# EAGLE board RU-PCBA-2X2-001-03 (EAGLE 9.7.0), part 1 of 17
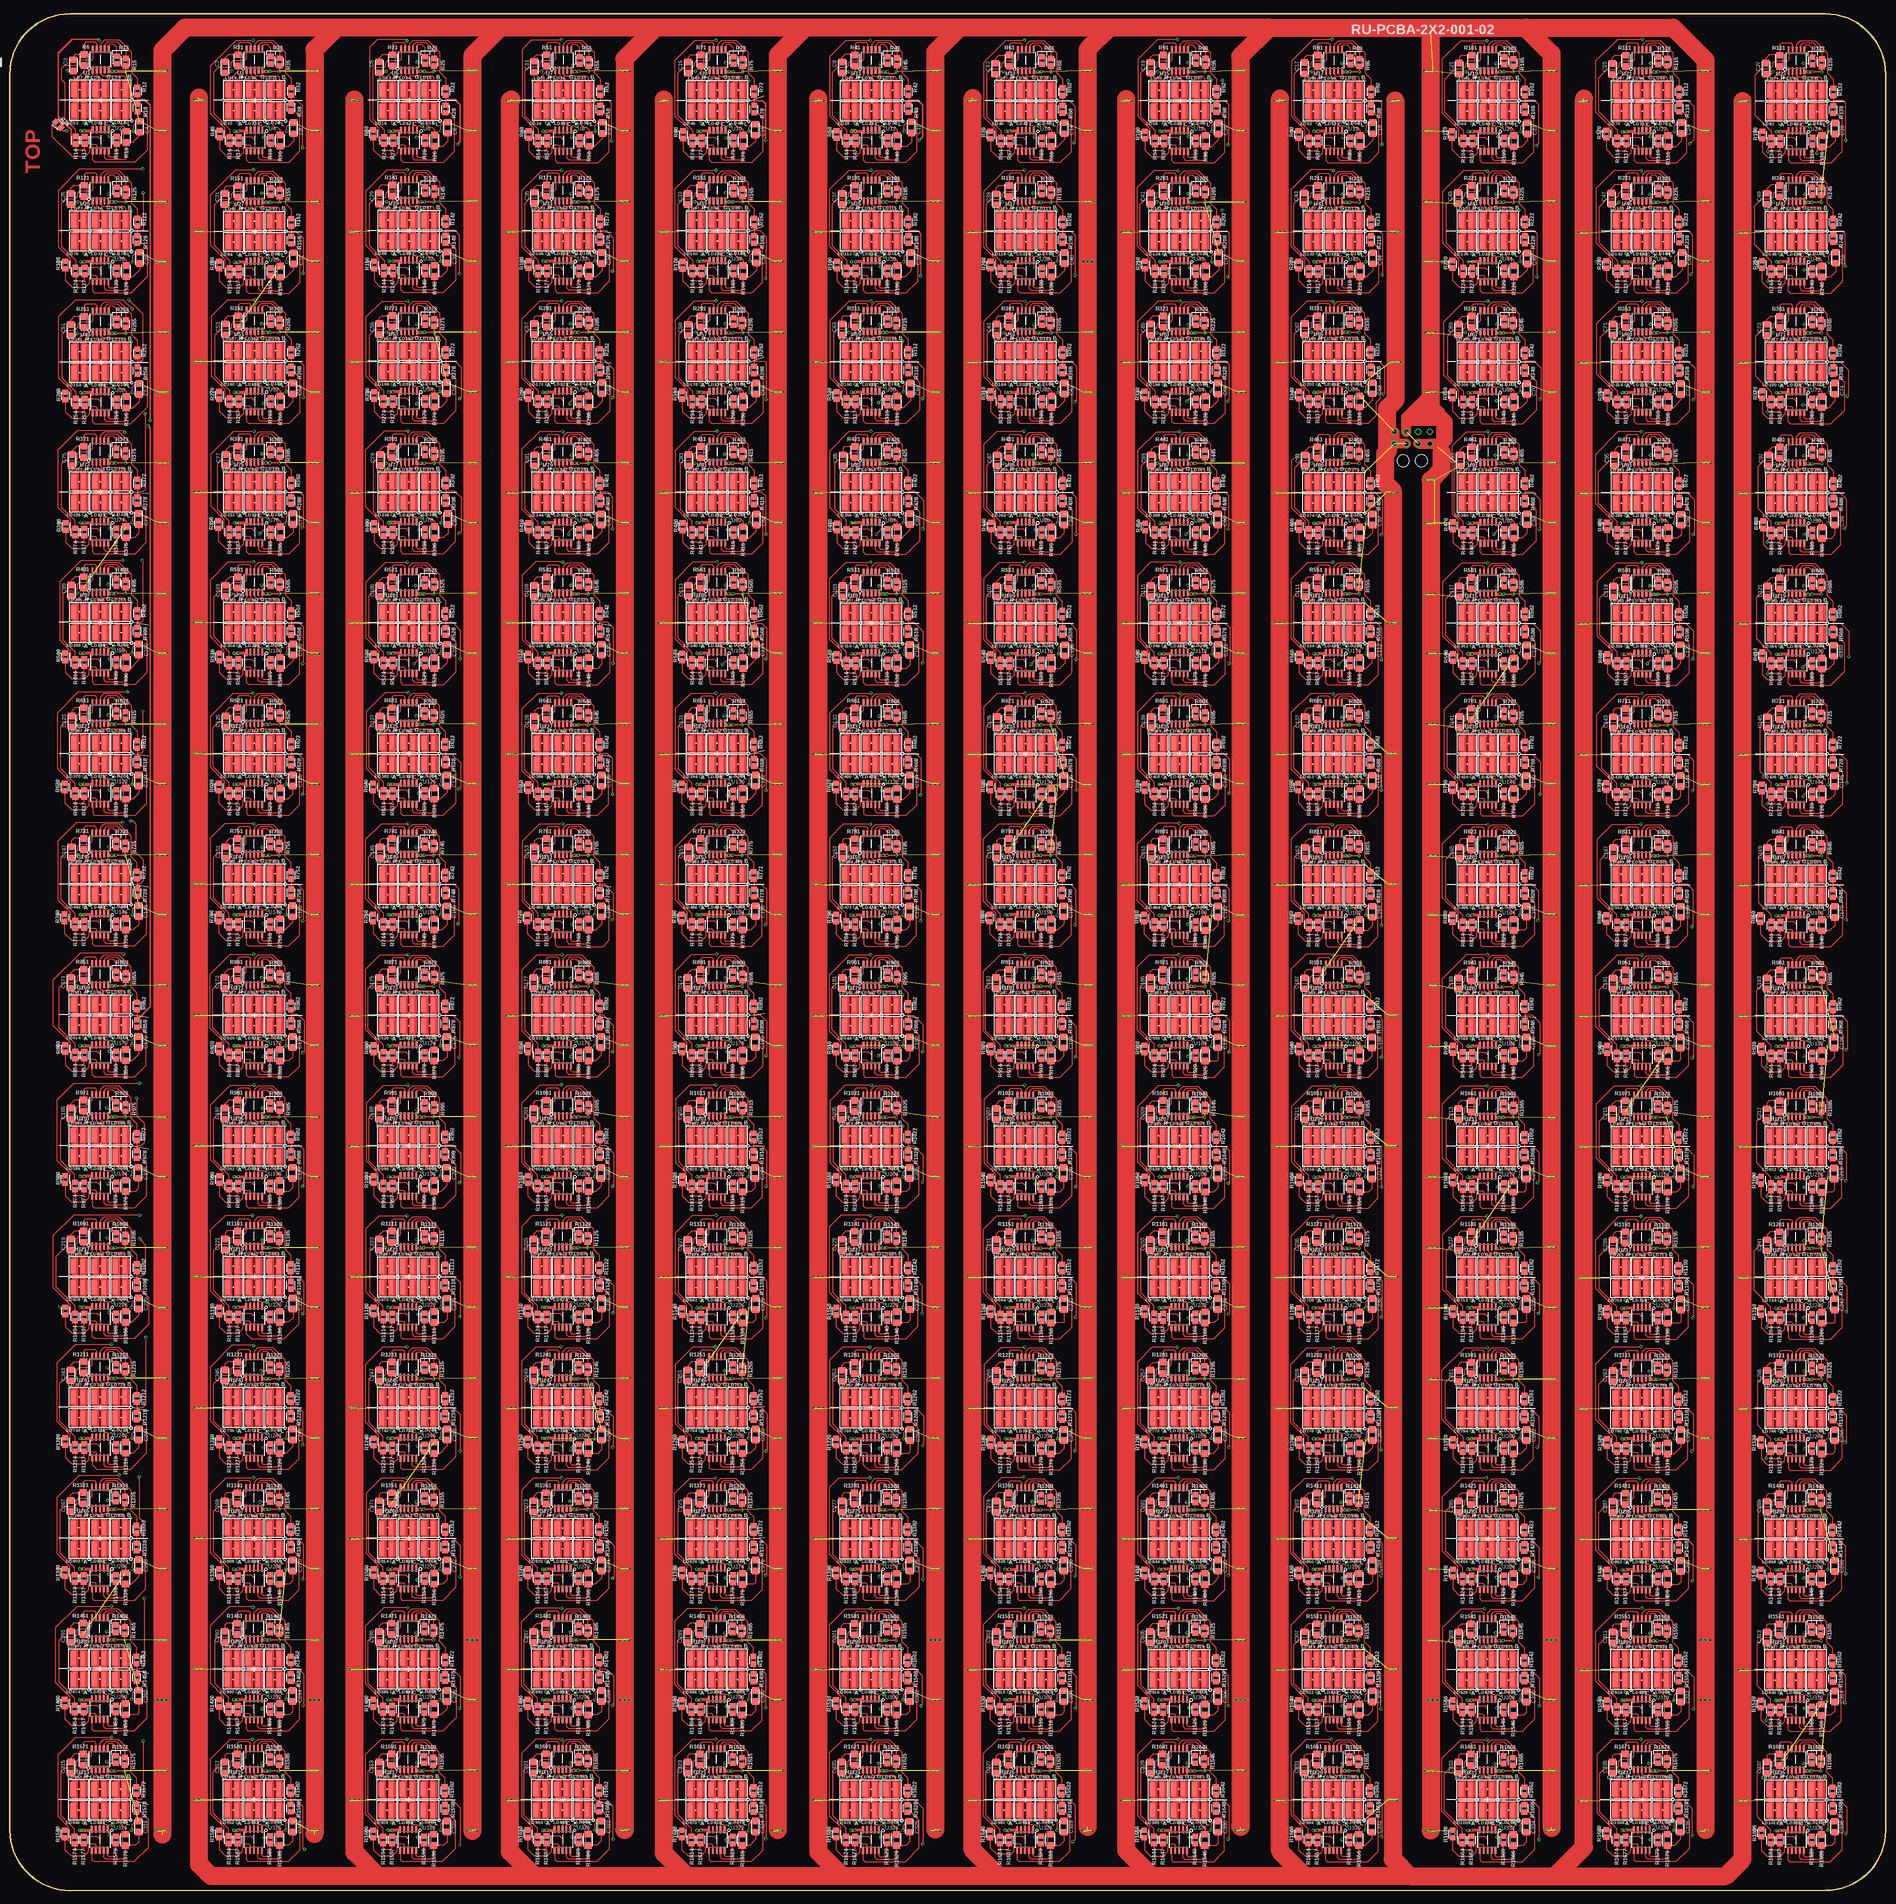
[diagram p31: board, top side]
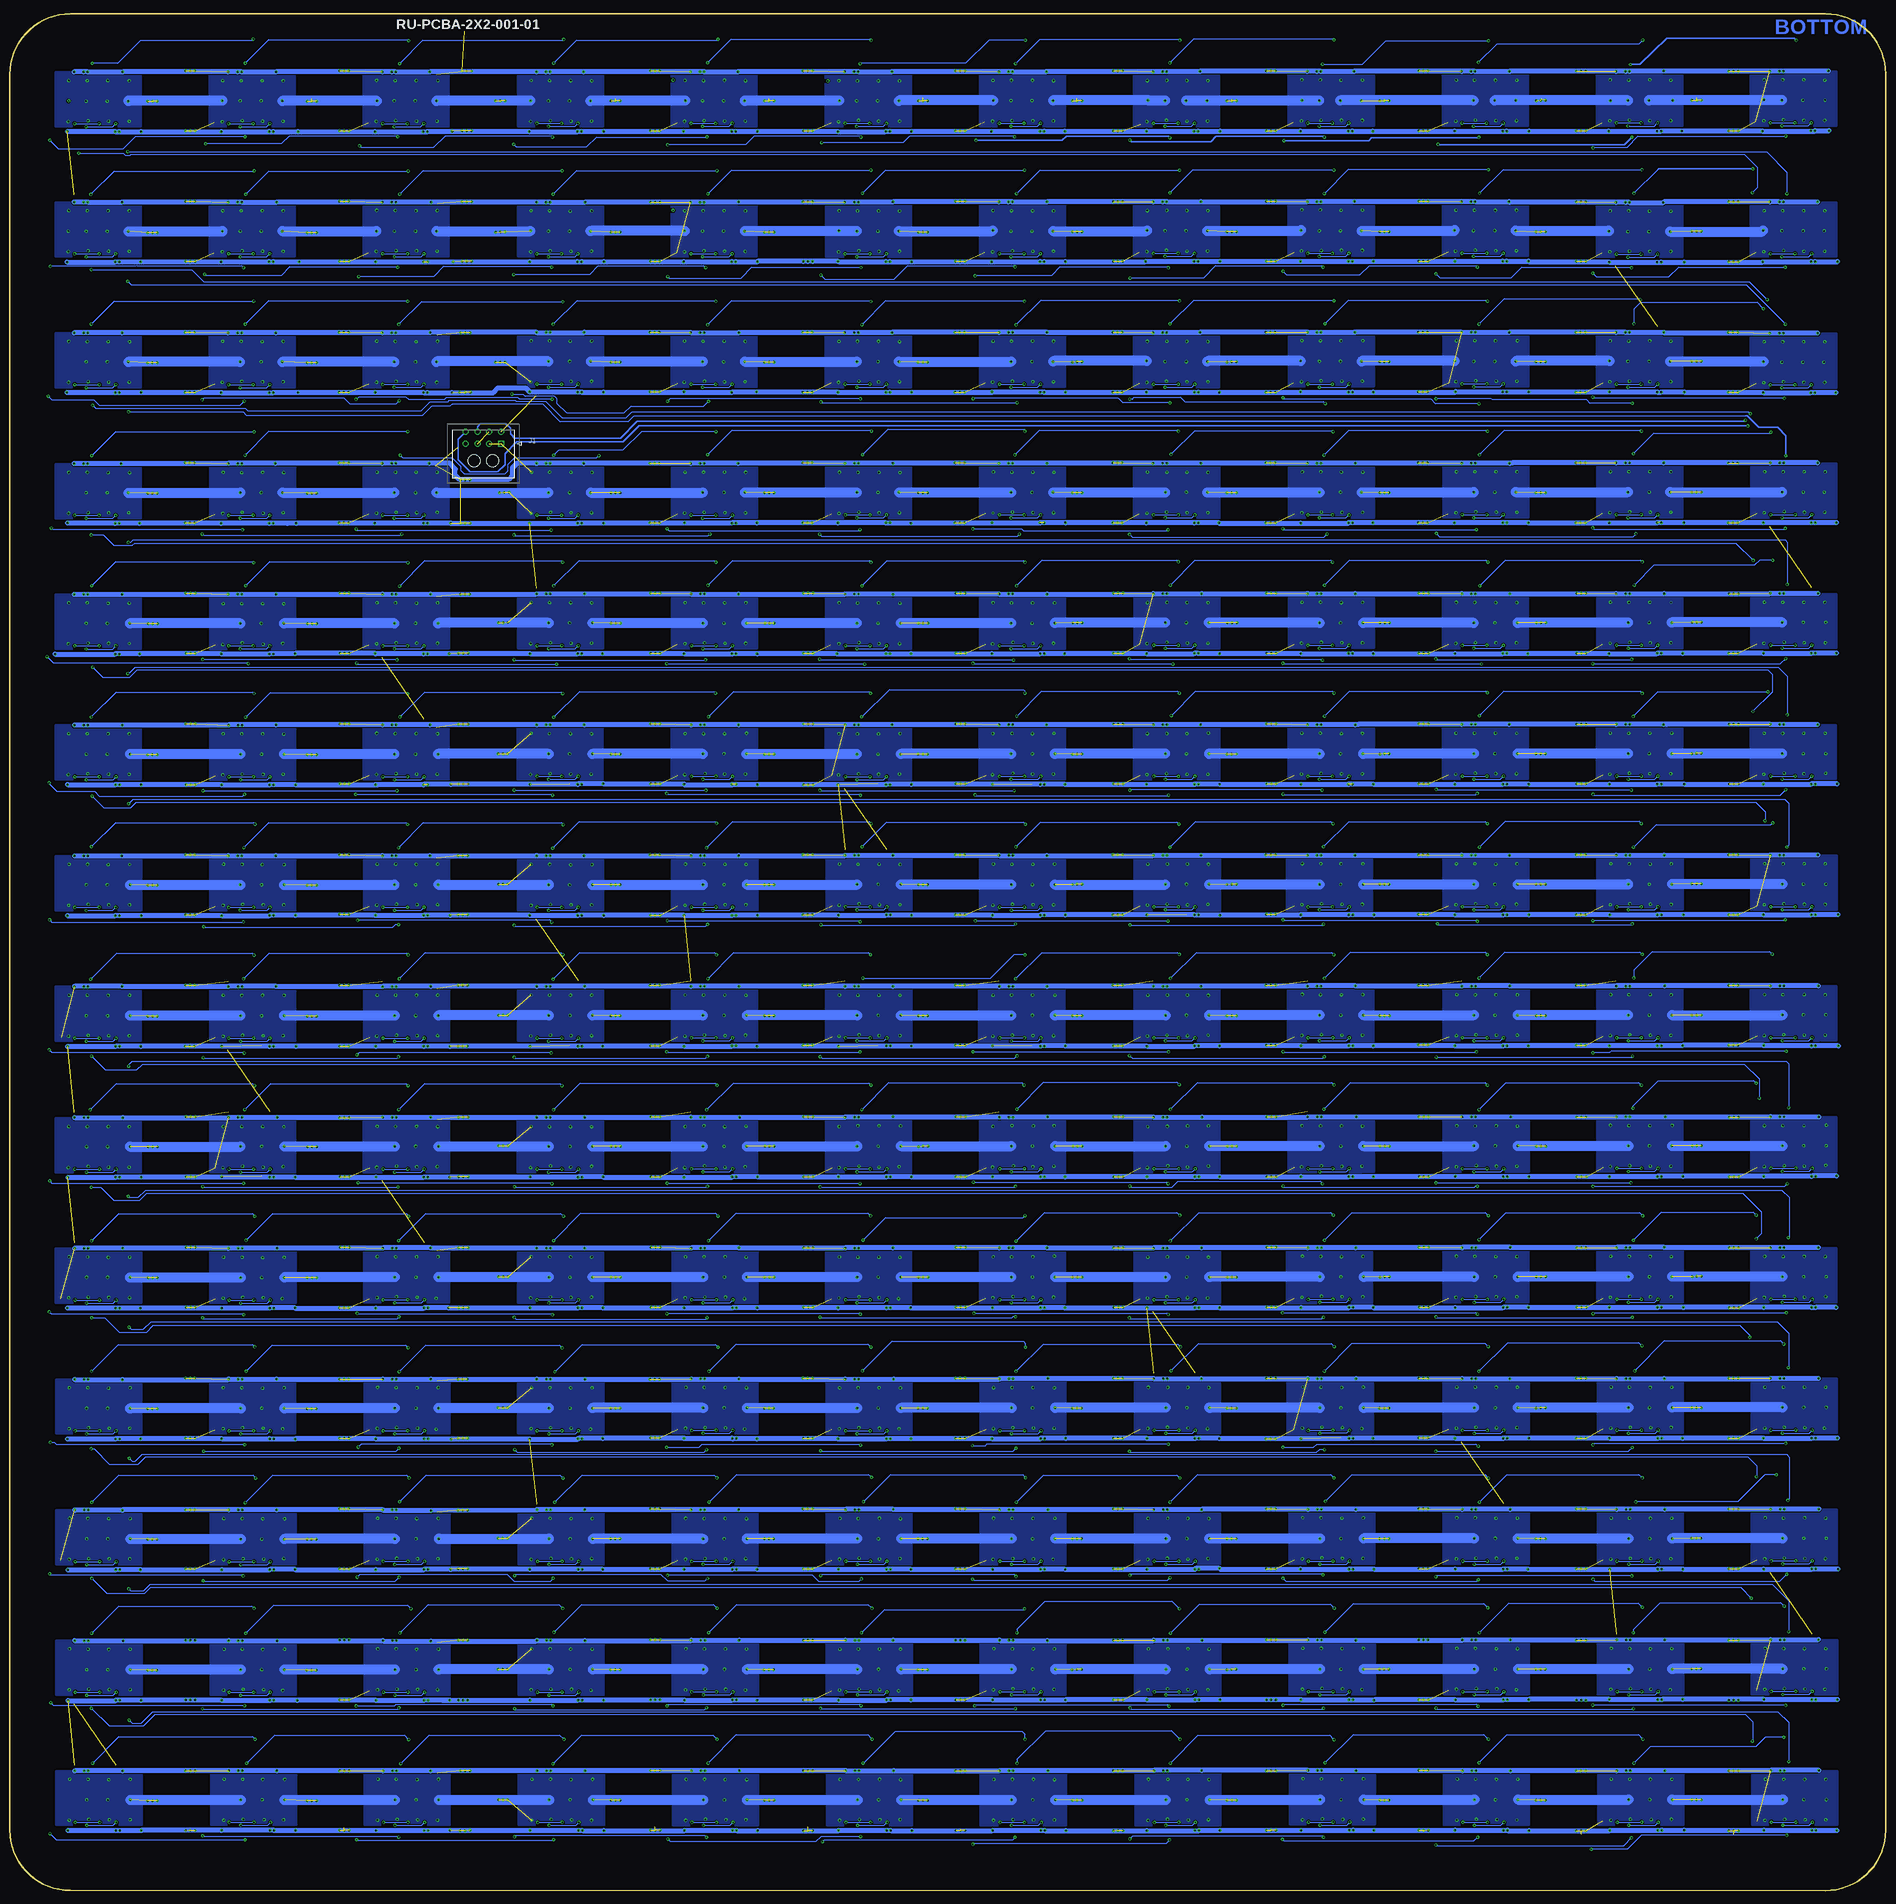
[diagram p32: board, bottom side, seen from below]

Size 474.97 x 475.07 mm. Coordinates in mm from the lower left corner, seen from the top.
Outline: 0,15.32 0,459.83 arc-90 15.22,475.07 459.63,475.07 arc-90 474.97,459.73 474.97,15.28 arc-90 459.72,0.03 15.31,0 arc-90 0,15.32
Copper layers (1*16): Top 0.035mm / dielectric 1.5mm / Bottom 0.035mm
Design rules "Fusion Electronics Design Rules": minimum track width 6mil, minimum drill 0.35mm, track to track 6mil, track to pad 6mil, pad to pad 6mil, via to via 6mil, smd to smd 6mil, copper to edge 40mil, drill to drill 6mil, minimum pad ring 10mil, minimum via ring 8mil, stop-mask expansion 4mil, vias tented up to drill 0mil, thermal gap 10mil

## Footprints (pad centres in the part's own frame; a part is rotated, then mirrored left to right if it is on the bottom)
C1206 = smd 1.6 x 1.8: 1 -1.4,0; 2 1.4,0
43045-08(00,01,02,10) = drill 1.02 pad 1.52 square: 1 0,0 | drill 1.02 pad 1.52: 2 -3,0; 3 -6,0; 4 -9,0; 5 0,3; 6 -3,3; 7 -6,3; 8 -9,3 | hole 3: -2.16,-4.32; -6.84,-4.32
5050LED = smd 1.27 x 3.5: A -1.445,0.01 | smd 1 x 3.5: K 0.95,0
R1206 = smd 1.6 x 1.803: 1 -1.422,0; 2 1.422,0
R0805 = smd 1.3 x 1.5: 1 -0.95,0; 2 0.95,0
SOP100P600X175-10N = smd 1.66 x 0.6: 1 -2.625,2; 2 -2.625,1; 3 -2.625,0; 4 -2.625,-1; 5 -2.625,-2; 6 2.625,-2; 7 2.625,-1; 8 2.625,0; 9 2.625,1; 10 2.625,2

## Placement (x,y rotation side)
C3  [C1206]  16,462.04 270 top
C4  [C1206]  32.93,446.48 90 top
C5  [C1206]  93.46,461.56 270 top
C6  [C1206]  110.89,446.22 90 top
C7  [C1206]  54.38,461.54 270 top
C8  [C1206]  71.84,446.13 90 top
C9  [C1206]  210.69,461.52 270 top
C10  [C1206]  228.25,446.34 90 top
C11  [C1206]  132.76,461.67 270 top
C12  [C1206]  150.09,446.21 90 top
C13  [C1206]  249.5,461.17 270 top
C14  [C1206]  267.01,446.11 90 top
C15  [C1206]  171.67,461.47 270 top
C16  [C1206]  188.75,445.74 90 top
C17  [C1206]  327.73,461.32 270 top
C18  [C1206]  345.14,446.12 90 top
C19  [C1206]  288.81,461.42 270 top
C20  [C1206]  306.03,446.07 90 top
C21  [C1206]  366.91,461.19 270 top
C22  [C1206]  384.27,446.08 90 top
C23  [C1206]  405.71,461.11 270 top
C24  [C1206]  423.27,446.17 90 top
C25  [C1206]  15.44,428.23 270 top
C26  [C1206]  32.84,413.3 90 top
C27  [C1206]  444.59,461.22 270 top
C28  [C1206]  462.17,446.06 90 top
C29  [C1206]  93.52,428.36 270 top
C30  [C1206]  110.78,413.38 90 top
C31  [C1206]  54.43,428.2 270 top
C32  [C1206]  71.88,413.17 90 top
C33  [C1206]  171.61,428.22 270 top
C34  [C1206]  189.04,413.38 90 top
C35  [C1206]  132.8,428.49 270 top
C36  [C1206]  149.89,413.27 90 top
C37  [C1206]  210.7,428.23 270 top
C38  [C1206]  228.19,413.26 90 top
C39  [C1206]  249.72,428.12 270 top
C40  [C1206]  267.08,413.26 90 top
C41  [C1206]  288.76,428.29 270 top
C42  [C1206]  306.1,413.34 90 top
C43  [C1206]  327.61,428.32 270 top
C44  [C1206]  345.1,413.19 90 top
C45  [C1206]  366.62,428.43 270 top
C46  [C1206]  384.2,413.15 90 top
C47  [C1206]  405.5,428.29 270 top
C48  [C1206]  423.42,413.24 90 top
C49  [C1206]  444.81,428.27 270 top
C50  [C1206]  462.33,413.33 90 top
C51  [C1206]  15.41,395 270 top
C52  [C1206]  32.74,380.13 90 top
C53  [C1206]  54.56,395.23 270 top
C54  [C1206]  71.67,380.23 90 top
C55  [C1206]  93.56,395.28 270 top
C56  [C1206]  110.64,380.33 90 top
C57  [C1206]  132.73,395.29 270 top
C58  [C1206]  149.93,380.32 90 top
C59  [C1206]  171.67,395.11 270 top
C60  [C1206]  188.9,380.21 90 top
C61  [C1206]  249.78,395.14 270 top
C62  [C1206]  267.03,380.22 90 top
C63  [C1206]  210.68,395.18 270 top
C64  [C1206]  228.03,380.25 90 top
C65  [C1206]  288.77,395.16 270 top
C66  [C1206]  305.94,380.19 90 top
C67  [C1206]  327.83,395.25 270 top
C68  [C1206]  345.03,380.28 90 top
C69  [C1206]  366.73,395.12 270 top
C70  [C1206]  384.07,380.06 90 top
C71  [C1206]  405.87,395.16 270 top
C72  [C1206]  423.12,380.08 90 top
C73  [C1206]  444.88,395.07 270 top
C74  [C1206]  462.12,380.18 90 top
C75  [C1206]  15.66,362.14 270 top
C76  [C1206]  32.68,347.2 90 top
C77  [C1206]  54.68,362.13 270 top
C78  [C1206]  71.71,347.23 90 top
C79  [C1206]  93.76,362.12 270 top
C80  [C1206]  110.91,347.18 90 top
C81  [C1206]  132.82,362.08 270 top
C82  [C1206]  149.76,347.09 90 top
C83  [C1206]  171.88,362.08 270 top
C84  [C1206]  189.07,347.08 90 top
C85  [C1206]  210.9,362.07 270 top
C86  [C1206]  227.96,347.2 90 top
C87  [C1206]  249.93,362.07 270 top
C88  [C1206]  266.95,347.1 90 top
C89  [C1206]  288.97,362.04 270 top
C90  [C1206]  305.91,347.11 90 top
C91  [C1206]  327.95,362.03 270 top
C92  [C1206]  345.05,347.1 90 top
C93  [C1206]  367.2,362.07 270 top
C94  [C1206]  384.17,347.14 90 top
C95  [C1206]  406.21,362.04 270 top
C96  [C1206]  423.15,347.01 90 top
C97  [C1206]  445.25,362.01 270 top
C98  [C1206]  462.08,347.11 90 top
C99  [C1206]  15.57,329.08 270 top
C100  [C1206]  32.68,314.19 90 top
C101  [C1206]  54.58,329.02 270 top
C102  [C1206]  71.72,314.15 90 top
C103  [C1206]  210.8,328.93 270 top
C104  [C1206]  227.94,314.04 90 top
C105  [C1206]  93.66,328.98 270 top
C106  [C1206]  110.75,314.11 90 top
C107  [C1206]  249.84,328.92 270 top
C108  [C1206]  267.13,313.98 90 top
C109  [C1206]  132.72,328.98 270 top
C110  [C1206]  149.8,314.09 90 top
C111  [C1206]  327.88,328.96 270 top
C112  [C1206]  344.88,314.07 90 top
C113  [C1206]  171.78,329.02 270 top
C114  [C1206]  188.79,314.16 90 top
C115  [C1206]  288.85,328.94 270 top
C116  [C1206]  306.03,314.1 90 top
C117  [C1206]  366.94,328.87 270 top
C118  [C1206]  384.16,313.94 90 top
C119  [C1206]  405.99,328.84 270 top
C120  [C1206]  422.98,313.94 90 top
C121  [C1206]  444.99,328.83 270 top
C122  [C1206]  461.81,313.85 90 top
C123  [C1206]  15.62,295.91 270 top
C124  [C1206]  32.64,281.02 90 top
C125  [C1206]  54.62,295.9 270 top
C126  [C1206]  71.64,281.02 90 top
C127  [C1206]  93.69,295.9 270 top
C128  [C1206]  110.71,281.02 90 top
C129  [C1206]  132.78,295.84 270 top
C130  [C1206]  149.79,280.95 90 top
C131  [C1206]  171.81,295.85 270 top
C132  [C1206]  188.82,280.96 90 top
C133  [C1206]  210.83,295.84 270 top
C134  [C1206]  227.85,280.95 90 top
C135  [C1206]  249.89,295.77 270 top
C136  [C1206]  266.91,280.89 90 top
C137  [C1206]  327.94,295.81 270 top
C138  [C1206]  344.95,280.93 90 top
C139  [C1206]  288.9,295.82 270 top
C140  [C1206]  305.91,280.94 90 top
C141  [C1206]  366.99,295.78 270 top
C142  [C1206]  384.01,280.9 90 top
C143  [C1206]  405.99,295.73 270 top
C144  [C1206]  423,280.85 90 top
C145  [C1206]  445,295.75 270 top
C146  [C1206]  462.02,280.87 90 top
C147  [C1206]  15.59,262.84 270 top
C148  [C1206]  32.61,247.96 90 top
C149  [C1206]  93.69,262.79 270 top
C150  [C1206]  110.71,247.91 90 top
C151  [C1206]  54.59,262.81 270 top
C152  [C1206]  71.61,247.93 90 top
C153  [C1206]  132.75,262.78 270 top
C154  [C1206]  149.77,247.9 90 top
C155  [C1206]  171.79,262.78 270 top
C156  [C1206]  188.8,247.89 90 top
C157  [C1206]  210.83,262.75 270 top
C158  [C1206]  227.84,247.86 90 top
C159  [C1206]  249.83,262.78 270 top
C160  [C1206]  266.85,247.89 90 top
C161  [C1206]  288.89,262.72 270 top
C162  [C1206]  305.91,247.83 90 top
C163  [C1206]  327.94,262.67 270 top
C164  [C1206]  344.95,247.78 90 top
C165  [C1206]  366.98,262.69 270 top
C166  [C1206]  383.99,247.81 90 top
C167  [C1206]  406,262.67 270 top
C168  [C1206]  423.02,247.79 90 top
C169  [C1206]  445.01,262.64 270 top
C170  [C1206]  462.02,247.76 90 top
C171  [C1206]  15.42,229.81 270 top
C172  [C1206]  32.57,214.83 90 top
C173  [C1206]  54.43,229.78 270 top
C174  [C1206]  71.58,214.8 90 top
C175  [C1206]  93.51,229.75 270 top
C176  [C1206]  110.66,214.77 90 top
C177  [C1206]  132.58,229.77 270 top
C178  [C1206]  149.73,214.79 90 top
C179  [C1206]  171.61,229.73 270 top
C180  [C1206]  188.75,214.75 90 top
C181  [C1206]  210.66,229.7 270 top
C182  [C1206]  227.8,214.72 90 top
C183  [C1206]  249.67,229.72 270 top
C184  [C1206]  266.82,214.74 90 top
C185  [C1206]  288.73,229.71 270 top
C186  [C1206]  305.88,214.73 90 top
C187  [C1206]  327.76,229.69 270 top
C188  [C1206]  344.9,214.71 90 top
C189  [C1206]  366.78,229.64 270 top
C190  [C1206]  383.93,214.66 90 top
C191  [C1206]  405.83,229.63 270 top
C192  [C1206]  422.98,214.65 90 top
C193  [C1206]  444.83,229.63 270 top
C194  [C1206]  461.98,214.65 90 top
C195  [C1206]  15.38,196.7 270 top
C196  [C1206]  32.52,181.72 90 top
C197  [C1206]  54.41,196.67 270 top
C198  [C1206]  71.56,181.69 90 top
C199  [C1206]  93.48,196.67 270 top
C200  [C1206]  110.63,181.69 90 top
C201  [C1206]  132.57,196.64 270 top
C202  [C1206]  149.71,181.66 90 top
C203  [C1206]  171.57,196.61 270 top
C204  [C1206]  188.72,181.63 90 top
C205  [C1206]  210.62,196.61 270 top
C206  [C1206]  227.77,181.63 90 top
C207  [C1206]  249.67,196.59 270 top
C208  [C1206]  266.82,181.61 90 top
C209  [C1206]  288.71,196.56 270 top
C210  [C1206]  305.86,181.58 90 top
C211  [C1206]  327.76,196.54 270 top
C212  [C1206]  344.9,181.56 90 top
C213  [C1206]  366.76,196.53 270 top
C214  [C1206]  383.91,181.55 90 top
C215  [C1206]  405.79,196.53 270 top
C216  [C1206]  422.94,181.55 90 top
C217  [C1206]  444.82,196.5 270 top
C218  [C1206]  461.97,181.52 90 top
C219  [C1206]  15.45,163.54 270 top
C220  [C1206]  32.66,148.58 90 top
C221  [C1206]  54.46,163.54 270 top
C222  [C1206]  71.68,148.59 90 top
C223  [C1206]  93.53,163.51 270 top
C224  [C1206]  110.74,148.55 90 top
C225  [C1206]  132.59,163.5 270 top
C226  [C1206]  149.8,148.55 90 top
C227  [C1206]  171.64,163.43 270 top
C228  [C1206]  188.85,148.47 90 top
C229  [C1206]  210.7,163.45 270 top
C230  [C1206]  227.91,148.5 90 top
C231  [C1206]  249.73,163.43 270 top
C232  [C1206]  266.95,148.47 90 top
C233  [C1206]  288.7,163.43 270 top
C234  [C1206]  305.92,148.47 90 top
C235  [C1206]  327.81,163.41 270 top
C236  [C1206]  345.02,148.45 90 top
C237  [C1206]  366.81,163.42 270 top
C238  [C1206]  384.02,148.46 90 top
C239  [C1206]  405.83,163.33 270 top
C240  [C1206]  423.05,148.37 90 top
C241  [C1206]  444.86,163.36 270 top
C242  [C1206]  462.07,148.4 90 top
C243  [C1206]  15.45,130.44 270 top
C244  [C1206]  32.66,115.49 90 top
C245  [C1206]  54.44,130.41 270 top
C246  [C1206]  71.66,115.45 90 top
C247  [C1206]  93.53,130.37 270 top
C248  [C1206]  110.74,115.42 90 top
C249  [C1206]  132.59,130.36 270 top
C250  [C1206]  149.8,115.4 90 top
C251  [C1206]  171.61,130.38 270 top
C252  [C1206]  188.83,115.43 90 top
C253  [C1206]  210.66,130.32 270 top
C254  [C1206]  227.88,115.36 90 top
C255  [C1206]  249.73,130.28 270 top
C256  [C1206]  266.95,115.32 90 top
C257  [C1206]  288.72,130.34 270 top
C258  [C1206]  305.94,115.39 90 top
C259  [C1206]  327.81,130.26 270 top
C260  [C1206]  345.02,115.31 90 top
C261  [C1206]  366.81,130.27 270 top
C262  [C1206]  384.02,115.31 90 top
C263  [C1206]  405.84,130.24 270 top
C264  [C1206]  423.05,115.29 90 top
C265  [C1206]  444.86,130.21 270 top
C266  [C1206]  462.07,115.25 90 top
C267  [C1206]  15.4,97.33 270 top
C268  [C1206]  32.61,82.37 90 top
C269  [C1206]  54.42,97.27 270 top
C270  [C1206]  71.63,82.31 90 top
C271  [C1206]  93.52,97.28 270 top
C272  [C1206]  110.73,82.33 90 top
C273  [C1206]  132.57,97.27 270 top
C274  [C1206]  149.79,82.32 90 top
C275  [C1206]  171.61,97.23 270 top
C276  [C1206]  188.83,82.28 90 top
C277  [C1206]  210.66,97.23 270 top
C278  [C1206]  227.87,82.27 90 top
C279  [C1206]  249.69,97.22 270 top
C280  [C1206]  266.9,82.27 90 top
C281  [C1206]  288.72,97.2 270 top
C282  [C1206]  305.94,82.24 90 top
C283  [C1206]  327.75,97.2 270 top
C284  [C1206]  344.96,82.24 90 top
C285  [C1206]  366.8,97.18 270 top
C286  [C1206]  384.01,82.23 90 top
C287  [C1206]  405.82,97.14 270 top
C288  [C1206]  423.03,82.19 90 top
C289  [C1206]  444.82,97.15 270 top
C290  [C1206]  462.03,82.2 90 top
C291  [C1206]  15.39,64.27 270 top
C292  [C1206]  32.6,49.31 90 top
C293  [C1206]  54.4,64.23 270 top
C294  [C1206]  71.62,49.27 90 top
C295  [C1206]  93.5,64.22 270 top
C296  [C1206]  110.71,49.27 90 top
C297  [C1206]  132.56,64.22 270 top
C298  [C1206]  149.78,49.26 90 top
C299  [C1206]  171.57,64.18 270 top
C300  [C1206]  188.79,49.22 90 top
C301  [C1206]  210.64,64.19 270 top
C302  [C1206]  227.85,49.23 90 top
C303  [C1206]  249.66,64.15 270 top
C304  [C1206]  266.88,49.19 90 top
C305  [C1206]  288.7,64.15 270 top
C306  [C1206]  305.91,49.2 90 top
C307  [C1206]  327.75,64.13 270 top
C308  [C1206]  344.97,49.17 90 top
C309  [C1206]  366.77,64.09 270 top
C310  [C1206]  383.98,49.13 90 top
C311  [C1206]  405.82,64.08 270 top
C312  [C1206]  423.04,49.13 90 top
C313  [C1206]  444.81,64.06 270 top
C314  [C1206]  462.02,49.11 90 top
C315  [C1206]  15.37,31.16 270 top
C316  [C1206]  32.58,16.2 90 top
C317  [C1206]  54.4,31.17 270 top
C318  [C1206]  71.62,16.22 90 top
C319  [C1206]  93.45,31.15 270 top
C320  [C1206]  110.67,16.19 90 top
C321  [C1206]  132.53,31.19 270 top
C322  [C1206]  149.75,16.23 90 top
C323  [C1206]  171.59,31.14 270 top
C324  [C1206]  188.8,16.18 90 top
C325  [C1206]  210.62,31.12 270 top
C326  [C1206]  227.84,16.17 90 top
C327  [C1206]  249.65,31.14 270 top
C328  [C1206]  266.86,16.18 90 top
C329  [C1206]  288.68,31.13 270 top
C330  [C1206]  305.89,16.17 90 top
C331  [C1206]  327.7,31.13 270 top
C332  [C1206]  344.92,16.17 90 top
C333  [C1206]  366.76,31.11 270 top
C334  [C1206]  383.97,16.15 90 top
C335  [C1206]  405.78,31.14 270 top
C336  [C1206]  422.99,16.18 90 top
C337  [C1206]  444.82,31.11 270 top
C338  [C1206]  462.03,16.15 90 top
J1  43045-0800  [43045-08(00,01,02,10)]  350.57,366.28 0 bottom
LD7  R  [5050LED]  17.7,455.87 0 top
LD8  G  [5050LED]  23,455.87 0 top
LD9  B  [5050LED]  28.3,455.87 0 top
LD10  A  [5050LED]  17.7,450.57 0 top
LD11  C  [5050LED]  23,450.57 0 top
LD12  L  [5050LED]  28.3,450.57 0 top
LD13  R  [5050LED]  95.77,455.79 0 top
LD14  G  [5050LED]  101.07,455.79 0 top
LD15  B  [5050LED]  106.37,455.79 0 top
LD16  A  [5050LED]  95.77,450.49 0 top
LD17  C  [5050LED]  101.07,450.49 0 top
LD18  L  [5050LED]  106.37,450.49 0 top
LD19  R  [5050LED]  56.67,455.8 0 top
LD20  G  [5050LED]  61.97,455.8 0 top
LD21  B  [5050LED]  67.27,455.8 0 top
LD22  A  [5050LED]  56.67,450.5 0 top
LD23  C  [5050LED]  61.97,450.5 0 top
LD24  L  [5050LED]  67.27,450.5 0 top
LD25  R  [5050LED]  212.9,455.74 0 top
LD26  G  [5050LED]  218.2,455.74 0 top
LD27  B  [5050LED]  223.5,455.74 0 top
LD28  A  [5050LED]  212.9,450.44 0 top
LD29  C  [5050LED]  218.2,450.44 0 top
LD30  L  [5050LED]  223.5,450.44 0 top
LD31  R  [5050LED]  134.84,455.76 0 top
LD32  G  [5050LED]  140.14,455.76 0 top
LD33  B  [5050LED]  145.44,455.76 0 top
LD34  A  [5050LED]  134.84,450.46 0 top
LD35  C  [5050LED]  140.14,450.46 0 top
LD36  L  [5050LED]  145.44,450.46 0 top
LD37  R  [5050LED]  251.96,455.72 0 top
LD38  G  [5050LED]  257.26,455.72 0 top
LD39  B  [5050LED]  262.56,455.72 0 top
LD40  A  [5050LED]  251.96,450.42 0 top
LD41  C  [5050LED]  257.26,450.42 0 top
LD42  L  [5050LED]  262.56,450.42 0 top
LD43  R  [5050LED]  173.88,455.75 0 top
LD44  G  [5050LED]  179.18,455.75 0 top
LD45  B  [5050LED]  184.48,455.75 0 top
LD46  A  [5050LED]  173.88,450.45 0 top
LD47  C  [5050LED]  179.18,450.45 0 top
LD48  L  [5050LED]  184.48,450.45 0 top
LD49  R  [5050LED]  330.01,455.69 0 top
LD50  G  [5050LED]  335.31,455.69 0 top
LD51  B  [5050LED]  340.61,455.69 0 top
LD52  A  [5050LED]  330.01,450.39 0 top
LD53  C  [5050LED]  335.31,450.39 0 top
LD54  L  [5050LED]  340.61,450.39 0 top
LD55  R  [5050LED]  290.97,455.71 0 top
LD56  G  [5050LED]  296.27,455.71 0 top
LD57  B  [5050LED]  301.57,455.71 0 top
LD58  A  [5050LED]  290.97,450.41 0 top
LD59  C  [5050LED]  296.27,450.41 0 top
LD60  L  [5050LED]  301.57,450.41 0 top
LD61  R  [5050LED]  369.04,455.67 0 top
LD62  G  [5050LED]  374.34,455.67 0 top
LD63  B  [5050LED]  379.64,455.67 0 top
LD64  A  [5050LED]  369.04,450.37 0 top
LD65  C  [5050LED]  374.34,450.37 0 top
LD66  L  [5050LED]  379.64,450.37 0 top
LD67  R  [5050LED]  408.07,455.67 0 top
LD68  G  [5050LED]  413.37,455.67 0 top
LD69  B  [5050LED]  418.67,455.67 0 top
LD70  A  [5050LED]  408.07,450.37 0 top
LD71  C  [5050LED]  413.37,450.37 0 top
LD72  L  [5050LED]  418.67,450.37 0 top
LD73  R  [5050LED]  17.67,422.75 0 top
LD74  G  [5050LED]  22.97,422.75 0 top
LD75  B  [5050LED]  28.27,422.75 0 top
LD76  A  [5050LED]  17.67,417.45 0 top
LD77  C  [5050LED]  22.97,417.45 0 top
LD78  L  [5050LED]  28.27,417.45 0 top
LD79  R  [5050LED]  447.07,455.63 0 top
LD80  G  [5050LED]  452.37,455.63 0 top
LD81  B  [5050LED]  457.67,455.63 0 top
LD82  A  [5050LED]  447.07,450.33 0 top
LD83  C  [5050LED]  452.37,450.33 0 top
LD84  L  [5050LED]  457.67,450.33 0 top
LD85  R  [5050LED]  95.76,422.84 0 top
LD86  G  [5050LED]  101.06,422.84 0 top
LD87  B  [5050LED]  106.36,422.84 0 top
LD88  A  [5050LED]  95.76,417.54 0 top
LD89  C  [5050LED]  101.06,417.54 0 top
LD90  L  [5050LED]  106.36,417.54 0 top
LD91  R  [5050LED]  56.67,422.61 0 top
LD92  G  [5050LED]  61.97,422.61 0 top
LD93  B  [5050LED]  67.27,422.61 0 top
LD94  A  [5050LED]  56.67,417.31 0 top
LD95  C  [5050LED]  61.97,417.31 0 top
LD96  L  [5050LED]  67.27,417.31 0 top
LD97  R  [5050LED]  173.87,422.78 0 top
LD98  G  [5050LED]  179.17,422.78 0 top
LD99  B  [5050LED]  184.47,422.78 0 top
LD100  A  [5050LED]  173.87,417.48 0 top
LD101  C  [5050LED]  179.17,417.48 0 top
LD102  L  [5050LED]  184.47,417.48 0 top
LD103  R  [5050LED]  134.82,422.8 0 top
LD104  G  [5050LED]  140.12,422.8 0 top
LD105  B  [5050LED]  145.42,422.8 0 top
LD106  A  [5050LED]  134.82,417.5 0 top
LD107  C  [5050LED]  140.12,417.5 0 top
LD108  L  [5050LED]  145.42,417.5 0 top
LD109  R  [5050LED]  212.9,422.74 0 top
LD110  G  [5050LED]  218.2,422.74 0 top
LD111  B  [5050LED]  223.5,422.74 0 top
LD112  A  [5050LED]  212.9,417.44 0 top
LD113  C  [5050LED]  218.2,417.44 0 top
LD114  L  [5050LED]  223.5,417.44 0 top
LD115  R  [5050LED]  251.93,422.71 0 top
LD116  G  [5050LED]  257.23,422.71 0 top
LD117  B  [5050LED]  262.53,422.71 0 top
LD118  A  [5050LED]  251.93,417.41 0 top
LD119  C  [5050LED]  257.23,417.41 0 top
LD120  L  [5050LED]  262.53,417.41 0 top
LD121  R  [5050LED]  290.97,422.71 0 top
LD122  G  [5050LED]  296.27,422.71 0 top
LD123  B  [5050LED]  301.57,422.71 0 top
LD124  A  [5050LED]  290.97,417.41 0 top
LD125  C  [5050LED]  296.27,417.41 0 top
LD126  L  [5050LED]  301.57,417.41 0 top
LD127  R  [5050LED]  330.01,422.69 0 top
LD128  G  [5050LED]  335.31,422.69 0 top
LD129  B  [5050LED]  340.61,422.69 0 top
LD130  A  [5050LED]  330.01,417.39 0 top
LD131  C  [5050LED]  335.31,417.39 0 top
LD132  L  [5050LED]  340.61,417.39 0 top
LD133  R  [5050LED]  369.01,422.71 0 top
LD134  G  [5050LED]  374.31,422.71 0 top
LD135  B  [5050LED]  379.61,422.71 0 top
LD136  A  [5050LED]  369.01,417.41 0 top
LD137  C  [5050LED]  374.31,417.41 0 top
LD138  L  [5050LED]  379.61,417.41 0 top
LD139  R  [5050LED]  408.04,422.72 0 top
LD140  G  [5050LED]  413.34,422.72 0 top
LD141  B  [5050LED]  418.64,422.72 0 top
LD142  A  [5050LED]  408.04,417.42 0 top
LD143  C  [5050LED]  413.34,417.42 0 top
LD144  L  [5050LED]  418.64,417.42 0 top
LD145  R  [5050LED]  447.05,422.67 0 top
LD146  G  [5050LED]  452.35,422.67 0 top
LD147  B  [5050LED]  457.65,422.67 0 top
LD148  A  [5050LED]  447.05,417.37 0 top
LD149  C  [5050LED]  452.35,417.37 0 top
LD150  L  [5050LED]  457.65,417.37 0 top
LD151  R  [5050LED]  17.7,389.55 0 top
LD152  G  [5050LED]  23,389.55 0 top
LD153  B  [5050LED]  28.3,389.55 0 top
LD154  A  [5050LED]  17.7,384.25 0 top
LD155  C  [5050LED]  23,384.25 0 top
LD156  L  [5050LED]  28.3,384.25 0 top
LD157  R  [5050LED]  56.66,389.73 0 top
LD158  G  [5050LED]  61.96,389.73 0 top
LD159  B  [5050LED]  67.26,389.73 0 top
LD160  A  [5050LED]  56.66,384.43 0 top
LD161  C  [5050LED]  61.96,384.43 0 top
LD162  L  [5050LED]  67.26,384.43 0 top
LD163  R  [5050LED]  95.74,389.75 0 top
LD164  G  [5050LED]  101.04,389.75 0 top
LD165  B  [5050LED]  106.34,389.75 0 top
LD166  A  [5050LED]  95.74,384.45 0 top
LD167  C  [5050LED]  101.04,384.45 0 top
LD168  L  [5050LED]  106.34,384.45 0 top
LD169  R  [5050LED]  134.8,389.73 0 top
LD170  G  [5050LED]  140.1,389.73 0 top
LD171  B  [5050LED]  145.4,389.73 0 top
LD172  A  [5050LED]  134.8,384.43 0 top
LD173  C  [5050LED]  140.1,384.43 0 top
LD174  L  [5050LED]  145.4,384.43 0 top
LD175  R  [5050LED]  173.85,389.68 0 top
LD176  G  [5050LED]  179.15,389.68 0 top
LD177  B  [5050LED]  184.45,389.68 0 top
LD178  A  [5050LED]  173.85,384.38 0 top
LD179  C  [5050LED]  179.15,384.38 0 top
LD180  L  [5050LED]  184.45,384.38 0 top
LD181  R  [5050LED]  251.93,389.69 0 top
LD182  G  [5050LED]  257.23,389.69 0 top
LD183  B  [5050LED]  262.53,389.69 0 top
LD184  A  [5050LED]  251.93,384.39 0 top
LD185  C  [5050LED]  257.23,384.39 0 top
LD186  L  [5050LED]  262.53,384.39 0 top
LD187  R  [5050LED]  212.87,389.7 0 top
LD188  G  [5050LED]  218.17,389.7 0 top
LD189  B  [5050LED]  223.47,389.7 0 top
LD190  A  [5050LED]  212.87,384.4 0 top
LD191  C  [5050LED]  218.17,384.4 0 top
LD192  L  [5050LED]  223.47,384.4 0 top
LD193  R  [5050LED]  290.96,389.66 0 top
LD194  G  [5050LED]  296.26,389.66 0 top
LD195  B  [5050LED]  301.56,389.66 0 top
LD196  A  [5050LED]  290.96,384.36 0 top
LD197  C  [5050LED]  296.26,384.36 0 top
LD198  L  [5050LED]  301.56,384.36 0 top
LD199  R  [5050LED]  329.96,389.73 0 top
LD200  G  [5050LED]  335.26,389.73 0 top
LD201  B  [5050LED]  340.56,389.73 0 top
LD202  A  [5050LED]  329.96,384.43 0 top
LD203  C  [5050LED]  335.26,384.43 0 top
LD204  L  [5050LED]  340.56,384.43 0 top
LD205  R  [5050LED]  369.02,389.61 0 top
LD206  G  [5050LED]  374.32,389.61 0 top
LD207  B  [5050LED]  379.62,389.61 0 top
LD208  A  [5050LED]  369.02,384.31 0 top
LD209  C  [5050LED]  374.32,384.31 0 top
LD210  L  [5050LED]  379.62,384.31 0 top
LD211  R  [5050LED]  408.06,389.6 0 top
LD212  G  [5050LED]  413.36,389.6 0 top
LD213  B  [5050LED]  418.66,389.6 0 top
LD214  A  [5050LED]  408.06,384.3 0 top
LD215  C  [5050LED]  413.36,384.3 0 top
LD216  L  [5050LED]  418.66,384.3 0 top
LD217  R  [5050LED]  447.03,389.59 0 top
LD218  G  [5050LED]  452.33,389.59 0 top
LD219  B  [5050LED]  457.63,389.59 0 top
LD220  A  [5050LED]  447.03,384.29 0 top
LD221  C  [5050LED]  452.33,384.29 0 top
LD222  L  [5050LED]  457.63,384.29 0 top
LD223  R  [5050LED]  17.62,356.67 0 top
LD224  G  [5050LED]  22.92,356.67 0 top
LD225  B  [5050LED]  28.22,356.67 0 top
LD226  A  [5050LED]  17.62,351.37 0 top
LD227  C  [5050LED]  22.92,351.37 0 top
LD228  L  [5050LED]  28.22,351.37 0 top
LD229  R  [5050LED]  56.64,356.66 0 top
LD230  G  [5050LED]  61.94,356.66 0 top
LD231  B  [5050LED]  67.24,356.66 0 top
LD232  A  [5050LED]  56.64,351.36 0 top
LD233  C  [5050LED]  61.94,351.36 0 top
LD234  L  [5050LED]  67.24,351.36 0 top
LD235  R  [5050LED]  95.73,356.65 0 top
LD236  G  [5050LED]  101.03,356.65 0 top
LD237  B  [5050LED]  106.33,356.65 0 top
LD238  A  [5050LED]  95.73,351.35 0 top
LD239  C  [5050LED]  101.03,351.35 0 top
LD240  L  [5050LED]  106.33,351.35 0 top
LD241  R  [5050LED]  134.79,356.61 0 top
LD242  G  [5050LED]  140.09,356.61 0 top
LD243  B  [5050LED]  145.39,356.61 0 top
LD244  A  [5050LED]  134.79,351.31 0 top
LD245  C  [5050LED]  140.09,351.31 0 top
LD246  L  [5050LED]  145.39,351.31 0 top
LD247  R  [5050LED]  173.84,356.61 0 top
LD248  G  [5050LED]  179.14,356.61 0 top
LD249  B  [5050LED]  184.44,356.61 0 top
LD250  A  [5050LED]  173.84,351.31 0 top
LD251  C  [5050LED]  179.14,351.31 0 top
LD252  L  [5050LED]  184.44,351.31 0 top
LD253  R  [5050LED]  212.86,356.6 0 top
LD254  G  [5050LED]  218.16,356.6 0 top
LD255  B  [5050LED]  223.46,356.6 0 top
LD256  A  [5050LED]  212.86,351.3 0 top
LD257  C  [5050LED]  218.16,351.3 0 top
LD258  L  [5050LED]  223.46,351.3 0 top
LD259  R  [5050LED]  251.9,356.6 0 top
LD260  G  [5050LED]  257.2,356.6 0 top
LD261  B  [5050LED]  262.5,356.6 0 top
LD262  A  [5050LED]  251.9,351.3 0 top
LD263  C  [5050LED]  257.2,351.3 0 top
LD264  L  [5050LED]  262.5,351.3 0 top
LD265  R  [5050LED]  290.93,356.57 0 top
LD266  G  [5050LED]  296.23,356.57 0 top
LD267  B  [5050LED]  301.53,356.57 0 top
LD268  A  [5050LED]  290.93,351.27 0 top
LD269  C  [5050LED]  296.23,351.27 0 top
LD270  L  [5050LED]  301.53,351.27 0 top
LD271  R  [5050LED]  329.96,356.53 0 top
LD272  G  [5050LED]  335.26,356.53 0 top
LD273  B  [5050LED]  340.56,356.53 0 top
LD274  A  [5050LED]  329.96,351.23 0 top
LD275  C  [5050LED]  335.26,351.23 0 top
LD276  L  [5050LED]  340.56,351.23 0 top
LD277  R  [5050LED]  369.02,356.54 0 top
LD278  G  [5050LED]  374.32,356.54 0 top
LD279  B  [5050LED]  379.62,356.54 0 top
LD280  A  [5050LED]  369.02,351.24 0 top
LD281  C  [5050LED]  374.32,351.24 0 top
LD282  L  [5050LED]  379.62,351.24 0 top
LD283  R  [5050LED]  408.03,356.51 0 top
LD284  G  [5050LED]  413.33,356.51 0 top
LD285  B  [5050LED]  418.63,356.51 0 top
LD286  A  [5050LED]  408.03,351.21 0 top
LD287  C  [5050LED]  413.33,351.21 0 top
LD288  L  [5050LED]  418.63,351.21 0 top
LD289  R  [5050LED]  447.07,356.48 0 top
LD290  G  [5050LED]  452.37,356.48 0 top
LD291  B  [5050LED]  457.67,356.48 0 top
LD292  A  [5050LED]  447.07,351.18 0 top
LD293  C  [5050LED]  452.37,351.18 0 top
LD294  L  [5050LED]  457.67,351.18 0 top
LD295  R  [5050LED]  17.62,323.66 0 top
LD296  G  [5050LED]  22.92,323.66 0 top
LD297  B  [5050LED]  28.22,323.66 0 top
LD298  A  [5050LED]  17.62,318.36 0 top
LD299  C  [5050LED]  22.92,318.36 0 top
LD300  L  [5050LED]  28.22,318.36 0 top
LD301  R  [5050LED]  56.63,323.6 0 top
LD302  G  [5050LED]  61.93,323.6 0 top
LD303  B  [5050LED]  67.23,323.6 0 top
LD304  A  [5050LED]  56.63,318.3 0 top
LD305  C  [5050LED]  61.93,318.3 0 top
LD306  L  [5050LED]  67.23,318.3 0 top
LD307  R  [5050LED]  212.85,323.51 0 top
LD308  G  [5050LED]  218.15,323.51 0 top
LD309  B  [5050LED]  223.45,323.51 0 top
LD310  A  [5050LED]  212.85,318.21 0 top
LD311  C  [5050LED]  218.15,318.21 0 top
LD312  L  [5050LED]  223.45,318.21 0 top
LD313  R  [5050LED]  95.71,323.56 0 top
LD314  G  [5050LED]  101.01,323.56 0 top
LD315  B  [5050LED]  106.31,323.56 0 top
LD316  A  [5050LED]  95.71,318.26 0 top
LD317  C  [5050LED]  101.01,318.26 0 top
LD318  L  [5050LED]  106.31,318.26 0 top
LD319  R  [5050LED]  251.89,323.5 0 top
LD320  G  [5050LED]  257.19,323.5 0 top
LD321  B  [5050LED]  262.49,323.5 0 top
LD322  A  [5050LED]  251.89,318.19 0 top
LD323  C  [5050LED]  257.19,318.19 0 top
LD324  L  [5050LED]  262.49,318.19 0 top
LD325  R  [5050LED]  134.77,323.56 0 top
LD326  G  [5050LED]  140.07,323.56 0 top
LD327  B  [5050LED]  145.37,323.56 0 top
LD328  A  [5050LED]  134.77,318.26 0 top
LD329  C  [5050LED]  140.07,318.26 0 top
LD330  L  [5050LED]  145.37,318.26 0 top
LD331  R  [5050LED]  329.93,323.54 0 top
LD332  G  [5050LED]  335.23,323.54 0 top
LD333  B  [5050LED]  340.53,323.54 0 top
LD334  A  [5050LED]  329.93,318.24 0 top
LD335  C  [5050LED]  335.23,318.24 0 top
LD336  L  [5050LED]  340.53,318.24 0 top
LD337  R  [5050LED]  173.82,323.6 0 top
LD338  G  [5050LED]  179.12,323.6 0 top
LD339  B  [5050LED]  184.42,323.6 0 top
LD340  A  [5050LED]  173.82,318.3 0 top
LD341  C  [5050LED]  179.12,318.3 0 top
LD342  L  [5050LED]  184.42,318.3 0 top
LD343  R  [5050LED]  290.9,323.52 0 top
LD344  G  [5050LED]  296.2,323.52 0 top
LD345  B  [5050LED]  301.5,323.52 0 top
LD346  A  [5050LED]  290.9,318.22 0 top
LD347  C  [5050LED]  296.2,318.22 0 top
LD348  L  [5050LED]  301.5,318.22 0 top
LD349  R  [5050LED]  368.99,323.45 0 top
LD350  G  [5050LED]  374.29,323.45 0 top
LD351  B  [5050LED]  379.59,323.45 0 top
LD352  A  [5050LED]  368.99,318.15 0 top
LD353  C  [5050LED]  374.29,318.15 0 top
LD354  L  [5050LED]  379.59,318.15 0 top
LD355  R  [5050LED]  408.04,323.42 0 top
LD356  G  [5050LED]  413.34,323.42 0 top
LD357  B  [5050LED]  418.64,323.42 0 top
LD358  A  [5050LED]  408.04,318.12 0 top
LD359  C  [5050LED]  413.34,318.12 0 top
LD360  L  [5050LED]  418.64,318.12 0 top
LD361  R  [5050LED]  447.04,323.41 0 top
LD362  G  [5050LED]  452.34,323.41 0 top
LD363  B  [5050LED]  457.64,323.41 0 top
LD364  A  [5050LED]  447.04,318.11 0 top
LD365  C  [5050LED]  452.34,318.11 0 top
LD366  L  [5050LED]  457.64,318.11 0 top
LD367  R  [5050LED]  17.62,290.48 0 top
LD368  G  [5050LED]  22.92,290.48 0 top
LD369  B  [5050LED]  28.22,290.48 0 top
LD370  A  [5050LED]  17.62,285.18 0 top
LD371  C  [5050LED]  22.92,285.18 0 top
LD372  L  [5050LED]  28.22,285.18 0 top
LD373  R  [5050LED]  56.62,290.48 0 top
LD374  G  [5050LED]  61.92,290.48 0 top
LD375  B  [5050LED]  67.22,290.48 0 top
LD376  A  [5050LED]  56.62,285.18 0 top
LD377  C  [5050LED]  61.92,285.18 0 top
LD378  L  [5050LED]  67.22,285.18 0 top
LD379  R  [5050LED]  95.69,290.48 0 top
LD380  G  [5050LED]  100.99,290.48 0 top
LD381  B  [5050LED]  106.29,290.48 0 top
LD382  A  [5050LED]  95.69,285.18 0 top
LD383  C  [5050LED]  100.99,285.18 0 top
LD384  L  [5050LED]  106.29,285.18 0 top
LD385  R  [5050LED]  134.77,290.41 0 top
LD386  G  [5050LED]  140.07,290.41 0 top
LD387  B  [5050LED]  145.37,290.41 0 top
LD388  A  [5050LED]  134.77,285.11 0 top
LD389  C  [5050LED]  140.07,285.11 0 top
LD390  L  [5050LED]  145.37,285.11 0 top
LD391  R  [5050LED]  173.8,290.42 0 top
LD392  G  [5050LED]  179.1,290.42 0 top
LD393  B  [5050LED]  184.4,290.42 0 top
LD394  A  [5050LED]  173.8,285.12 0 top
LD395  C  [5050LED]  179.1,285.12 0 top
LD396  L  [5050LED]  184.4,285.12 0 top
LD397  R  [5050LED]  212.83,290.41 0 top
LD398  G  [5050LED]  218.13,290.41 0 top
LD399  B  [5050LED]  223.43,290.41 0 top
LD400  A  [5050LED]  212.83,285.11 0 top
LD401  C  [5050LED]  218.13,285.11 0 top
LD402  L  [5050LED]  223.43,285.11 0 top
LD403  R  [5050LED]  251.89,290.35 0 top
LD404  G  [5050LED]  257.19,290.35 0 top
LD405  B  [5050LED]  262.49,290.35 0 top
LD406  A  [5050LED]  251.89,285.05 0 top
LD407  C  [5050LED]  257.19,285.05 0 top
LD408  L  [5050LED]  262.49,285.05 0 top
LD409  R  [5050LED]  329.93,290.39 0 top
LD410  G  [5050LED]  335.23,290.39 0 top
LD411  B  [5050LED]  340.53,290.39 0 top
LD412  A  [5050LED]  329.93,285.09 0 top
LD413  C  [5050LED]  335.23,285.09 0 top
LD414  L  [5050LED]  340.53,285.09 0 top
LD415  R  [5050LED]  290.89,290.4 0 top
LD416  G  [5050LED]  296.19,290.4 0 top
LD417  B  [5050LED]  301.49,290.4 0 top
LD418  A  [5050LED]  290.89,285.1 0 top
LD419  C  [5050LED]  296.19,285.1 0 top
LD420  L  [5050LED]  301.49,285.1 0 top
LD421  R  [5050LED]  368.99,290.36 0 top
LD422  G  [5050LED]  374.29,290.36 0 top
LD423  B  [5050LED]  379.59,290.36 0 top
LD424  A  [5050LED]  368.99,285.06 0 top
LD425  C  [5050LED]  374.29,285.06 0 top
LD426  L  [5050LED]  379.59,285.06 0 top
LD427  R  [5050LED]  407.98,290.31 0 top
LD428  G  [5050LED]  413.28,290.31 0 top
LD429  B  [5050LED]  418.58,290.31 0 top
LD430  A  [5050LED]  407.98,285 0 top
LD431  C  [5050LED]  413.28,285 0 top
LD432  L  [5050LED]  418.58,285 0 top
LD433  R  [5050LED]  447,290.33 0 top
LD434  G  [5050LED]  452.3,290.33 0 top
LD435  B  [5050LED]  457.6,290.33 0 top
LD436  A  [5050LED]  447,285.03 0 top
LD437  C  [5050LED]  452.3,285.03 0 top
LD438  L  [5050LED]  457.6,285.03 0 top
LD439  R  [5050LED]  17.59,257.42 0 top
LD440  G  [5050LED]  22.89,257.42 0 top
LD441  B  [5050LED]  28.19,257.42 0 top
LD442  A  [5050LED]  17.59,252.12 0 top
LD443  C  [5050LED]  22.89,252.12 0 top
LD444  L  [5050LED]  28.19,252.12 0 top
LD445  R  [5050LED]  95.69,257.37 0 top
LD446  G  [5050LED]  100.99,257.37 0 top
LD447  B  [5050LED]  106.29,257.37 0 top
LD448  A  [5050LED]  95.69,252.07 0 top
LD449  C  [5050LED]  100.99,252.07 0 top
LD450  L  [5050LED]  106.29,252.07 0 top
LD451  R  [5050LED]  56.59,257.39 0 top
LD452  G  [5050LED]  61.89,257.39 0 top
LD453  B  [5050LED]  67.19,257.39 0 top
LD454  A  [5050LED]  56.59,252.09 0 top
LD455  C  [5050LED]  61.89,252.09 0 top
LD456  L  [5050LED]  67.19,252.09 0 top
LD457  R  [5050LED]  134.75,257.36 0 top
LD458  G  [5050LED]  140.05,257.36 0 top
LD459  B  [5050LED]  145.35,257.36 0 top
LD460  A  [5050LED]  134.75,252.06 0 top
LD461  C  [5050LED]  140.05,252.06 0 top
LD462  L  [5050LED]  145.35,252.06 0 top
LD463  R  [5050LED]  173.78,257.36 0 top
LD464  G  [5050LED]  179.08,257.36 0 top
LD465  B  [5050LED]  184.38,257.36 0 top
LD466  A  [5050LED]  173.78,252.05 0 top
LD467  C  [5050LED]  179.08,252.05 0 top
LD468  L  [5050LED]  184.38,252.05 0 top
LD469  R  [5050LED]  212.82,257.32 0 top
LD470  G  [5050LED]  218.12,257.32 0 top
LD471  B  [5050LED]  223.42,257.32 0 top
LD472  A  [5050LED]  212.82,252.02 0 top
LD473  C  [5050LED]  218.12,252.02 0 top
LD474  L  [5050LED]  223.42,252.02 0 top
LD475  R  [5050LED]  251.83,257.35 0 top
LD476  G  [5050LED]  257.13,257.35 0 top
LD477  B  [5050LED]  262.43,257.35 0 top
LD478  A  [5050LED]  251.83,252.05 0 top
LD479  C  [5050LED]  257.13,252.05 0 top
LD480  L  [5050LED]  262.43,252.05 0 top
LD481  R  [5050LED]  290.89,257.3 0 top
LD482  G  [5050LED]  296.19,257.3 0 top
LD483  B  [5050LED]  301.49,257.3 0 top
LD484  A  [5050LED]  290.89,251.99 0 top
LD485  C  [5050LED]  296.19,251.99 0 top
LD486  L  [5050LED]  301.49,251.99 0 top
LD487  R  [5050LED]  329.93,257.24 0 top
LD488  G  [5050LED]  335.23,257.24 0 top
LD489  B  [5050LED]  340.53,257.24 0 top
LD490  A  [5050LED]  329.93,251.94 0 top
LD491  C  [5050LED]  335.23,251.94 0 top
LD492  L  [5050LED]  340.53,251.94 0 top
LD493  R  [5050LED]  368.97,257.27 0 top
LD494  G  [5050LED]  374.27,257.27 0 top
LD495  B  [5050LED]  379.57,257.27 0 top
LD496  A  [5050LED]  368.97,251.97 0 top
LD497  C  [5050LED]  374.27,251.97 0 top
LD498  L  [5050LED]  379.57,251.97 0 top
LD499  R  [5050LED]  408,257.25 0 top
LD500  G  [5050LED]  413.3,257.25 0 top
LD501  B  [5050LED]  418.6,257.25 0 top
LD502  A  [5050LED]  408,251.95 0 top
LD503  C  [5050LED]  413.3,251.95 0 top
LD504  L  [5050LED]  418.6,251.95 0 top
LD505  R  [5050LED]  447,257.22 0 top
LD506  G  [5050LED]  452.3,257.22 0 top
LD507  B  [5050LED]  457.6,257.22 0 top
LD508  A  [5050LED]  447,251.92 0 top
LD509  C  [5050LED]  452.3,251.92 0 top
LD510  L  [5050LED]  457.6,251.92 0 top
LD511  R  [5050LED]  17.58,224.29 0 top
LD512  G  [5050LED]  22.88,224.29 0 top
LD513  B  [5050LED]  28.18,224.29 0 top
LD514  A  [5050LED]  17.58,218.99 0 top
LD515  C  [5050LED]  22.88,218.99 0 top
LD516  L  [5050LED]  28.18,218.99 0 top
LD517  R  [5050LED]  56.59,224.26 0 top
LD518  G  [5050LED]  61.89,224.26 0 top
LD519  B  [5050LED]  67.19,224.26 0 top
LD520  A  [5050LED]  56.59,218.96 0 top
LD521  C  [5050LED]  61.89,218.96 0 top
LD522  L  [5050LED]  67.19,218.96 0 top
LD523  R  [5050LED]  95.67,224.23 0 top
LD524  G  [5050LED]  100.97,224.23 0 top
LD525  B  [5050LED]  106.27,224.23 0 top
LD526  A  [5050LED]  95.67,218.93 0 top
LD527  C  [5050LED]  100.97,218.93 0 top
LD528  L  [5050LED]  106.27,218.93 0 top
LD529  R  [5050LED]  134.74,224.25 0 top
LD530  G  [5050LED]  140.04,224.25 0 top
LD531  B  [5050LED]  145.34,224.25 0 top
LD532  A  [5050LED]  134.74,218.95 0 top
LD533  C  [5050LED]  140.04,218.95 0 top
LD534  L  [5050LED]  145.34,218.95 0 top
LD535  R  [5050LED]  173.76,224.21 0 top
LD536  G  [5050LED]  179.06,224.21 0 top
LD537  B  [5050LED]  184.36,224.21 0 top
LD538  A  [5050LED]  173.76,218.91 0 top
LD539  C  [5050LED]  179.06,218.91 0 top
LD540  L  [5050LED]  184.36,218.91 0 top
LD541  R  [5050LED]  212.81,224.18 0 top
LD542  G  [5050LED]  218.11,224.18 0 top
LD543  B  [5050LED]  223.41,224.18 0 top
LD544  A  [5050LED]  212.81,218.88 0 top
LD545  C  [5050LED]  218.11,218.88 0 top
LD546  L  [5050LED]  223.41,218.88 0 top
LD547  R  [5050LED]  251.83,224.2 0 top
LD548  G  [5050LED]  257.13,224.2 0 top
LD549  B  [5050LED]  262.43,224.2 0 top
LD550  A  [5050LED]  251.83,218.91 0 top
LD551  C  [5050LED]  257.13,218.91 0 top
LD552  L  [5050LED]  262.43,218.91 0 top
LD553  R  [5050LED]  290.89,224.19 0 top
LD554  G  [5050LED]  296.19,224.19 0 top
LD555  B  [5050LED]  301.49,224.19 0 top
LD556  A  [5050LED]  290.89,218.89 0 top
LD557  C  [5050LED]  296.19,218.89 0 top
LD558  L  [5050LED]  301.49,218.89 0 top
LD559  R  [5050LED]  329.91,224.17 0 top
LD560  G  [5050LED]  335.21,224.17 0 top
LD561  B  [5050LED]  340.51,224.17 0 top
LD562  A  [5050LED]  329.91,218.87 0 top
LD563  C  [5050LED]  335.21,218.87 0 top
LD564  L  [5050LED]  340.51,218.87 0 top
LD565  R  [5050LED]  368.94,224.12 0 top
LD566  G  [5050LED]  374.24,224.12 0 top
LD567  B  [5050LED]  379.54,224.12 0 top
LD568  A  [5050LED]  368.94,218.82 0 top
LD569  C  [5050LED]  374.24,218.82 0 top
LD570  L  [5050LED]  379.54,218.82 0 top
LD571  R  [5050LED]  407.99,224.11 0 top
LD572  G  [5050LED]  413.28,224.11 0 top
LD573  B  [5050LED]  418.58,224.11 0 top
LD574  A  [5050LED]  407.99,218.81 0 top
LD575  C  [5050LED]  413.28,218.81 0 top
LD576  L  [5050LED]  418.58,218.81 0 top
LD577  R  [5050LED]  446.99,224.11 0 top
LD578  G  [5050LED]  452.29,224.11 0 top
LD579  B  [5050LED]  457.59,224.11 0 top
LD580  A  [5050LED]  446.99,218.81 0 top
LD581  C  [5050LED]  452.29,218.81 0 top
LD582  L  [5050LED]  457.59,218.81 0 top
LD583  R  [5050LED]  17.53,191.18 0 top
LD584  G  [5050LED]  22.83,191.18 0 top
LD585  B  [5050LED]  28.13,191.18 0 top
LD586  A  [5050LED]  17.53,185.88 0 top
LD587  C  [5050LED]  22.83,185.88 0 top
LD588  L  [5050LED]  28.13,185.88 0 top
LD589  R  [5050LED]  56.57,191.15 0 top
LD590  G  [5050LED]  61.87,191.15 0 top
LD591  B  [5050LED]  67.17,191.15 0 top
LD592  A  [5050LED]  56.57,185.85 0 top
LD593  C  [5050LED]  61.87,185.85 0 top
LD594  L  [5050LED]  67.17,185.85 0 top
LD595  R  [5050LED]  95.64,191.15 0 top
LD596  G  [5050LED]  100.94,191.15 0 top
LD597  B  [5050LED]  106.24,191.15 0 top
LD598  A  [5050LED]  95.64,185.85 0 top
LD599  C  [5050LED]  100.94,185.85 0 top
LD600  L  [5050LED]  106.24,185.85 0 top
LD601  R  [5050LED]  134.72,191.12 0 top
LD602  G  [5050LED]  140.02,191.12 0 top
LD603  B  [5050LED]  145.32,191.12 0 top
LD604  A  [5050LED]  134.72,185.82 0 top
LD605  C  [5050LED]  140.02,185.82 0 top
LD606  L  [5050LED]  145.32,185.82 0 top
LD607  R  [5050LED]  173.73,191.09 0 top
LD608  G  [5050LED]  179.03,191.09 0 top
LD609  B  [5050LED]  184.33,191.09 0 top
LD610  A  [5050LED]  173.73,185.79 0 top
LD611  C  [5050LED]  179.03,185.79 0 top
LD612  L  [5050LED]  184.33,185.79 0 top
LD613  R  [5050LED]  212.78,191.09 0 top
LD614  G  [5050LED]  218.08,191.09 0 top
LD615  B  [5050LED]  223.38,191.09 0 top
LD616  A  [5050LED]  212.78,185.79 0 top
LD617  C  [5050LED]  218.08,185.79 0 top
LD618  L  [5050LED]  223.38,185.79 0 top
LD619  R  [5050LED]  251.83,191.07 0 top
LD620  G  [5050LED]  257.13,191.07 0 top
LD621  B  [5050LED]  262.43,191.07 0 top
LD622  A  [5050LED]  251.83,185.77 0 top
LD623  C  [5050LED]  257.13,185.77 0 top
LD624  L  [5050LED]  262.43,185.77 0 top
LD625  R  [5050LED]  290.86,191.04 0 top
LD626  G  [5050LED]  296.16,191.04 0 top
LD627  B  [5050LED]  301.46,191.04 0 top
LD628  A  [5050LED]  290.86,185.74 0 top
LD629  C  [5050LED]  296.16,185.74 0 top
LD630  L  [5050LED]  301.46,185.74 0 top
LD631  R  [5050LED]  329.91,191.02 0 top
LD632  G  [5050LED]  335.21,191.02 0 top
LD633  B  [5050LED]  340.51,191.02 0 top
LD634  A  [5050LED]  329.91,185.72 0 top
LD635  C  [5050LED]  335.21,185.72 0 top
LD636  L  [5050LED]  340.51,185.72 0 top
LD637  R  [5050LED]  368.92,191.01 0 top
LD638  G  [5050LED]  374.22,191.01 0 top
LD639  B  [5050LED]  379.52,191.01 0 top
LD640  A  [5050LED]  368.92,185.71 0 top
LD641  C  [5050LED]  374.22,185.71 0 top
LD642  L  [5050LED]  379.52,185.71 0 top
LD643  R  [5050LED]  407.95,191.01 0 top
LD644  G  [5050LED]  413.25,191.01 0 top
LD645  B  [5050LED]  418.55,191.01 0 top
LD646  A  [5050LED]  407.95,185.71 0 top
LD647  C  [5050LED]  413.25,185.71 0 top
LD648  L  [5050LED]  418.55,185.71 0 top
LD649  R  [5050LED]  446.97,190.98 0 top
LD650  G  [5050LED]  452.27,190.98 0 top
LD651  B  [5050LED]  457.57,190.98 0 top
LD652  A  [5050LED]  446.97,185.68 0 top
LD653  C  [5050LED]  452.27,185.68 0 top
LD654  L  [5050LED]  457.57,185.68 0 top
LD655  R  [5050LED]  17.54,158.03 0 top
LD656  G  [5050LED]  22.84,158.03 0 top
LD657  B  [5050LED]  28.14,158.03 0 top
LD658  A  [5050LED]  17.54,152.73 0 top
LD659  C  [5050LED]  22.84,152.73 0 top
LD660  L  [5050LED]  28.14,152.73 0 top
LD661  R  [5050LED]  56.56,158.04 0 top
LD662  G  [5050LED]  61.86,158.04 0 top
LD663  B  [5050LED]  67.16,158.04 0 top
LD664  A  [5050LED]  56.56,152.74 0 top
LD665  C  [5050LED]  61.86,152.74 0 top
LD666  L  [5050LED]  67.16,152.74 0 top
LD667  R  [5050LED]  95.62,158 0 top
LD668  G  [5050LED]  100.92,158 0 top
LD669  B  [5050LED]  106.22,158 0 top
LD670  A  [5050LED]  95.62,152.7 0 top
LD671  C  [5050LED]  100.92,152.7 0 top
LD672  L  [5050LED]  106.22,152.7 0 top
LD673  R  [5050LED]  134.68,158 0 top
LD674  G  [5050LED]  139.98,158 0 top
LD675  B  [5050LED]  145.28,158 0 top
LD676  A  [5050LED]  134.68,152.7 0 top
LD677  C  [5050LED]  139.98,152.7 0 top
LD678  L  [5050LED]  145.28,152.7 0 top
LD679  R  [5050LED]  173.73,157.92 0 top
LD680  G  [5050LED]  179.03,157.92 0 top
LD681  B  [5050LED]  184.33,157.92 0 top
LD682  A  [5050LED]  173.73,152.62 0 top
LD683  C  [5050LED]  179.03,152.62 0 top
LD684  L  [5050LED]  184.33,152.62 0 top
LD685  R  [5050LED]  212.79,157.95 0 top
LD686  G  [5050LED]  218.09,157.95 0 top
LD687  B  [5050LED]  223.39,157.95 0 top
LD688  A  [5050LED]  212.79,152.65 0 top
LD689  C  [5050LED]  218.09,152.65 0 top
LD690  L  [5050LED]  223.39,152.65 0 top
LD691  R  [5050LED]  251.83,157.92 0 top
LD692  G  [5050LED]  257.13,157.92 0 top
LD693  B  [5050LED]  262.43,157.92 0 top
LD694  A  [5050LED]  251.83,152.62 0 top
LD695  C  [5050LED]  257.13,152.62 0 top
LD696  L  [5050LED]  262.43,152.62 0 top
LD697  R  [5050LED]  290.8,157.93 0 top
LD698  G  [5050LED]  296.1,157.93 0 top
LD699  B  [5050LED]  301.4,157.93 0 top
LD700  A  [5050LED]  290.8,152.63 0 top
LD701  C  [5050LED]  296.1,152.63 0 top
LD702  L  [5050LED]  301.4,152.63 0 top
LD703  R  [5050LED]  329.9,157.91 0 top
LD704  G  [5050LED]  335.2,157.91 0 top
LD705  B  [5050LED]  340.5,157.91 0 top
LD706  A  [5050LED]  329.9,152.61 0 top
LD707  C  [5050LED]  335.2,152.61 0 top
LD708  L  [5050LED]  340.5,152.61 0 top
LD709  R  [5050LED]  368.9,157.91 0 top
LD710  G  [5050LED]  374.2,157.91 0 top
LD711  B  [5050LED]  379.5,157.91 0 top
LD712  A  [5050LED]  368.9,152.61 0 top
LD713  C  [5050LED]  374.2,152.61 0 top
LD714  L  [5050LED]  379.5,152.61 0 top
LD715  R  [5050LED]  407.92,157.82 0 top
LD716  G  [5050LED]  413.22,157.82 0 top
LD717  B  [5050LED]  418.52,157.82 0 top
LD718  A  [5050LED]  407.92,152.52 0 top
LD719  C  [5050LED]  413.22,152.52 0 top
LD720  L  [5050LED]  418.52,152.52 0 top
LD721  R  [5050LED]  446.95,157.85 0 top
LD722  G  [5050LED]  452.25,157.85 0 top
LD723  B  [5050LED]  457.55,157.85 0 top
LD724  A  [5050LED]  446.95,152.55 0 top
LD725  C  [5050LED]  452.25,152.55 0 top
LD726  L  [5050LED]  457.55,152.55 0 top
LD727  R  [5050LED]  17.54,124.94 0 top
LD728  G  [5050LED]  22.84,124.94 0 top
LD729  B  [5050LED]  28.14,124.94 0 top
LD730  A  [5050LED]  17.54,119.64 0 top
LD731  C  [5050LED]  22.84,119.64 0 top
LD732  L  [5050LED]  28.14,119.64 0 top
LD733  R  [5050LED]  56.54,124.91 0 top
LD734  G  [5050LED]  61.84,124.91 0 top
LD735  B  [5050LED]  67.14,124.91 0 top
LD736  A  [5050LED]  56.54,119.61 0 top
LD737  C  [5050LED]  61.84,119.61 0 top
LD738  L  [5050LED]  67.14,119.61 0 top
LD739  R  [5050LED]  95.62,124.87 0 top
LD740  G  [5050LED]  100.92,124.87 0 top
LD741  B  [5050LED]  106.22,124.87 0 top
LD742  A  [5050LED]  95.62,119.57 0 top
LD743  C  [5050LED]  100.92,119.57 0 top
LD744  L  [5050LED]  106.22,119.57 0 top
LD745  R  [5050LED]  134.68,124.85 0 top
LD746  G  [5050LED]  139.98,124.85 0 top
LD747  B  [5050LED]  145.28,124.85 0 top
LD748  A  [5050LED]  134.68,119.55 0 top
LD749  C  [5050LED]  139.98,119.55 0 top
LD750  L  [5050LED]  145.28,119.55 0 top
LD751  R  [5050LED]  173.71,124.88 0 top
LD752  G  [5050LED]  179.01,124.88 0 top
LD753  B  [5050LED]  184.31,124.88 0 top
LD754  A  [5050LED]  173.71,119.58 0 top
LD755  C  [5050LED]  179.01,119.58 0 top
LD756  L  [5050LED]  184.31,119.58 0 top
LD757  R  [5050LED]  212.76,124.82 0 top
LD758  G  [5050LED]  218.06,124.82 0 top
LD759  B  [5050LED]  223.36,124.82 0 top
LD760  A  [5050LED]  212.76,119.52 0 top
LD761  C  [5050LED]  218.06,119.52 0 top
LD762  L  [5050LED]  223.36,119.52 0 top
LD763  R  [5050LED]  251.83,124.78 0 top
LD764  G  [5050LED]  257.13,124.78 0 top
LD765  B  [5050LED]  262.43,124.78 0 top
LD766  A  [5050LED]  251.83,119.48 0 top
LD767  C  [5050LED]  257.13,119.48 0 top
LD768  L  [5050LED]  262.43,119.48 0 top
LD769  R  [5050LED]  290.82,124.84 0 top
LD770  G  [5050LED]  296.12,124.84 0 top
LD771  B  [5050LED]  301.42,124.84 0 top
LD772  A  [5050LED]  290.82,119.54 0 top
LD773  C  [5050LED]  296.12,119.54 0 top
LD774  L  [5050LED]  301.42,119.54 0 top
LD775  R  [5050LED]  329.9,124.76 0 top
LD776  G  [5050LED]  335.2,124.76 0 top
LD777  B  [5050LED]  340.5,124.76 0 top
LD778  A  [5050LED]  329.9,119.46 0 top
LD779  C  [5050LED]  335.2,119.46 0 top
LD780  L  [5050LED]  340.5,119.46 0 top
LD781  R  [5050LED]  368.9,124.77 0 top
LD782  G  [5050LED]  374.2,124.77 0 top
LD783  B  [5050LED]  379.5,124.77 0 top
LD784  A  [5050LED]  368.9,119.47 0 top
LD785  C  [5050LED]  374.2,119.47 0 top
LD786  L  [5050LED]  379.5,119.47 0 top
LD787  R  [5050LED]  407.93,124.74 0 top
LD788  G  [5050LED]  413.23,124.74 0 top
LD789  B  [5050LED]  418.53,124.74 0 top
LD790  A  [5050LED]  407.93,119.44 0 top
LD791  C  [5050LED]  413.23,119.44 0 top
LD792  L  [5050LED]  418.53,119.44 0 top
LD793  R  [5050LED]  446.95,124.7 0 top
LD794  G  [5050LED]  452.25,124.7 0 top
LD795  B  [5050LED]  457.55,124.7 0 top
LD796  A  [5050LED]  446.95,119.41 0 top
LD797  C  [5050LED]  452.25,119.41 0 top
LD798  L  [5050LED]  457.55,119.41 0 top
LD799  R  [5050LED]  17.49,91.82 0 top
LD800  G  [5050LED]  22.79,91.82 0 top
LD801  B  [5050LED]  28.09,91.82 0 top
LD802  A  [5050LED]  17.49,86.52 0 top
LD803  C  [5050LED]  22.79,86.52 0 top
LD804  L  [5050LED]  28.09,86.52 0 top
LD805  R  [5050LED]  56.51,91.77 0 top
LD806  G  [5050LED]  61.81,91.77 0 top
LD807  B  [5050LED]  67.11,91.77 0 top
LD808  A  [5050LED]  56.51,86.47 0 top
LD809  C  [5050LED]  61.81,86.47 0 top
LD810  L  [5050LED]  67.11,86.47 0 top
LD811  R  [5050LED]  95.61,91.78 0 top
LD812  G  [5050LED]  100.91,91.78 0 top
LD813  B  [5050LED]  106.21,91.78 0 top
LD814  A  [5050LED]  95.61,86.48 0 top
LD815  C  [5050LED]  100.91,86.48 0 top
LD816  L  [5050LED]  106.21,86.48 0 top
LD817  R  [5050LED]  134.67,91.77 0 top
LD818  G  [5050LED]  139.97,91.77 0 top
LD819  B  [5050LED]  145.27,91.77 0 top
LD820  A  [5050LED]  134.67,86.47 0 top
LD821  C  [5050LED]  139.97,86.47 0 top
LD822  L  [5050LED]  145.27,86.47 0 top
LD823  R  [5050LED]  173.71,91.73 0 top
LD824  G  [5050LED]  179.01,91.73 0 top
LD825  B  [5050LED]  184.31,91.73 0 top
LD826  A  [5050LED]  173.71,86.43 0 top
LD827  C  [5050LED]  179.01,86.43 0 top
LD828  L  [5050LED]  184.31,86.43 0 top
LD829  R  [5050LED]  212.75,91.72 0 top
LD830  G  [5050LED]  218.05,91.72 0 top
LD831  B  [5050LED]  223.35,91.72 0 top
LD832  A  [5050LED]  212.75,86.42 0 top
LD833  C  [5050LED]  218.05,86.42 0 top
LD834  L  [5050LED]  223.35,86.42 0 top
LD835  R  [5050LED]  251.78,91.72 0 top
LD836  G  [5050LED]  257.08,91.72 0 top
LD837  B  [5050LED]  262.38,91.72 0 top
LD838  A  [5050LED]  251.78,86.42 0 top
LD839  C  [5050LED]  257.08,86.42 0 top
LD840  L  [5050LED]  262.38,86.42 0 top
LD841  R  [5050LED]  290.82,91.69 0 top
LD842  G  [5050LED]  296.12,91.69 0 top
LD843  B  [5050LED]  301.42,91.69 0 top
LD844  A  [5050LED]  290.82,86.39 0 top
LD845  C  [5050LED]  296.12,86.39 0 top
LD846  L  [5050LED]  301.42,86.39 0 top
LD847  R  [5050LED]  329.84,91.69 0 top
LD848  G  [5050LED]  335.14,91.69 0 top
LD849  B  [5050LED]  340.44,91.69 0 top
LD850  A  [5050LED]  329.84,86.39 0 top
LD851  C  [5050LED]  335.14,86.39 0 top
LD852  L  [5050LED]  340.44,86.39 0 top
LD853  R  [5050LED]  368.89,91.68 0 top
LD854  G  [5050LED]  374.19,91.68 0 top
LD855  B  [5050LED]  379.49,91.68 0 top
LD856  A  [5050LED]  368.89,86.38 0 top
LD857  C  [5050LED]  374.19,86.38 0 top
LD858  L  [5050LED]  379.49,86.38 0 top
LD859  R  [5050LED]  407.91,91.64 0 top
LD860  G  [5050LED]  413.21,91.64 0 top
LD861  B  [5050LED]  418.51,91.64 0 top
LD862  A  [5050LED]  407.91,86.34 0 top
LD863  C  [5050LED]  413.21,86.34 0 top
LD864  L  [5050LED]  418.51,86.34 0 top
LD865  R  [5050LED]  446.91,91.65 0 top
LD866  G  [5050LED]  452.21,91.65 0 top
LD867  B  [5050LED]  457.51,91.65 0 top
LD868  A  [5050LED]  446.91,86.35 0 top
LD869  C  [5050LED]  452.21,86.35 0 top
LD870  L  [5050LED]  457.51,86.35 0 top
LD871  R  [5050LED]  17.48,58.76 0 top
LD872  G  [5050LED]  22.78,58.76 0 top
LD873  B  [5050LED]  28.08,58.76 0 top
LD874  A  [5050LED]  17.48,53.46 0 top
LD875  C  [5050LED]  22.78,53.46 0 top
LD876  L  [5050LED]  28.08,53.46 0 top
LD877  R  [5050LED]  56.49,58.73 0 top
LD878  G  [5050LED]  61.79,58.73 0 top
LD879  B  [5050LED]  67.09,58.73 0 top
LD880  A  [5050LED]  56.49,53.43 0 top
LD881  C  [5050LED]  61.79,53.43 0 top
LD882  L  [5050LED]  67.09,53.43 0 top
LD883  R  [5050LED]  95.59,58.72 0 top
LD884  G  [5050LED]  100.89,58.72 0 top
LD885  B  [5050LED]  106.19,58.72 0 top
LD886  A  [5050LED]  95.59,53.42 0 top
LD887  C  [5050LED]  100.89,53.42 0 top
LD888  L  [5050LED]  106.19,53.42 0 top
LD889  R  [5050LED]  134.66,58.71 0 top
LD890  G  [5050LED]  139.96,58.71 0 top
LD891  B  [5050LED]  145.26,58.71 0 top
LD892  A  [5050LED]  134.66,53.41 0 top
LD893  C  [5050LED]  139.96,53.41 0 top
LD894  L  [5050LED]  145.26,53.41 0 top
LD895  R  [5050LED]  173.67,58.67 0 top
LD896  G  [5050LED]  178.97,58.67 0 top
LD897  B  [5050LED]  184.27,58.67 0 top
LD898  A  [5050LED]  173.67,53.37 0 top
LD899  C  [5050LED]  178.97,53.37 0 top
LD900  L  [5050LED]  184.27,53.37 0 top
LD901  R  [5050LED]  212.73,58.68 0 top
LD902  G  [5050LED]  218.03,58.68 0 top
LD903  B  [5050LED]  223.33,58.68 0 top
LD904  A  [5050LED]  212.73,53.38 0 top
LD905  C  [5050LED]  218.03,53.38 0 top